# Altium schematic sheet sys-power.SchDoc
size A4; SheetNumber: 14; SheetTotal: 17
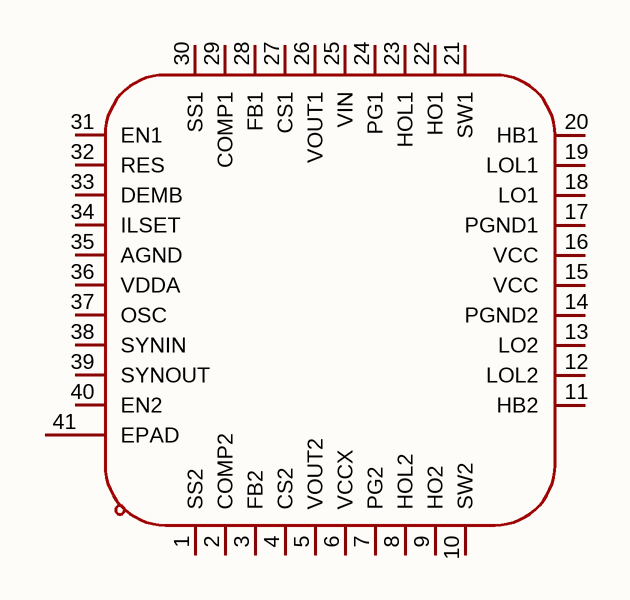
[diagram p0: sys-power.SchDoc]

## Parts
U??  lm5140qrwgtq1  [VQFN-40_L6.0-W6.0-P0.50-BL-EP]  (value not drawn)

## Nets

Not connected (* = marked no-connect by the designer): U?? 1(SS2) 2(COMP2) 3(FB2) 4(CS2) 5(VOUT2) 6(VCCX) 7(PG2) 8(HOL2) 9(HO2) 10(SW2) 11(HB2) 12(LOL2) 13(LO2) 14(PGND2) 15(VCC) 16(VCC) 17(PGND1) 18(LO1) 19(LOL1) 20(HB1) 21(SW1) 22(HO1) 23(HOL1) 24(PG1) 25(VIN) 26(VOUT1) 27(CS1) 28(FB1) 29(COMP1) 30(SS1) 31(EN1) 32(RES) 33(DEMB) 34(ILSET) 35(AGND) 36(VDDA) 37(OSC) 38(SYNIN) 39(SYNOUT) 40(EN2) 41(EPAD)

## Library data of the parts
U?? = lm5140qrwgtq1: 功能类型:降压型;工作电压:3.8V~65V;输出电压:1.5V~15V;输出电流:-;输出类型:可调;; Manufacturer: TI(德州仪器); AddInBom: yes; ModelId: 9abaade914744556b7a2df475e9925e7; ModelName: VQFN-40_L6.0-W6.0-H1.0-P0.50; ModelTransform: 237.007,237.007,0,90,0,0,-0.005,0.005,0; Function: 降压型; Frequency - Switching: 440kHz; Synchronous Rectifier: 是; Number of Outputs: 2; Topology: 降压式; Quiescent Current: 35uA; Switch tube (built-in/external): 外置; Output Type: 可调; Symbol: LM5140QRWGTQ1; LCSC Part Name: 降压型 3.8V~65V; SupplierPart: C201623; ManufacturerPart: LM5140QRWGTQ1; Supplier Footprint: VQFN-40-EP(6x6); JLCPCB Part Class: Extended Part; Datasheet: https://www.ti.com/cn/lit/gpn/lm5140-q1; Supplier: LCSC; ConvertToPcb: yes; FootprintName: VQFN-40_L6.0-W6.0-P0.50-BL-EP; Voltage - Supply: 3.8V~65V; Output Voltage: 1.5V~15V; Output Current: -; Operating Temperature: -40℃~+150℃@(TJ); Features: 轻载高效模式；频率同步；逐波限流；可调软启动；过流保护；工作状态指示；可调限流；打嗝限流